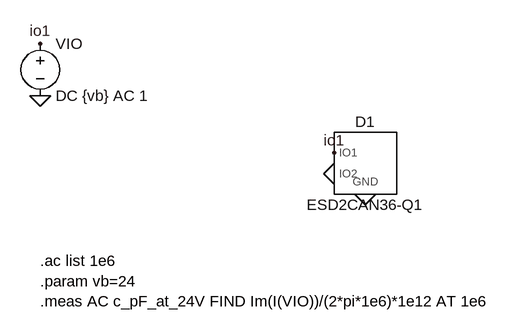
[diagram p0: schematic Model_test_ESD2CAN36_C24.asc]
Model_test_ESD2CAN36_C24.asc, the LTspice schematic file:
Version 4
SHEET 1 1400 700
SYMBOL ESD2CAN36-Q1 600 300 R0
SYMATTR InstName D1
FLAG 552 284 io1
FLAG 552 316 0
FLAG 600 348 0
SYMBOL voltage 100 100 R0
SYMATTR InstName VIO
SYMATTR Value DC {vb} AC 1
FLAG 100 116 io1
FLAG 100 196 0
TEXT 100 450 Left 2 !.ac list 1e6\n.param vb=24\n.meas AC c_pF_at_24V FIND Im(I(VIO))/(2*pi*1e6)*1e12 AT 1e6

The netlist it stands for:
* Model_test_ESD2CAN36_C24.asc
XD1 io1 0 0 ESD2CAN36-Q1  ; pins IO1 IO2 GND
VIO io1 0 DC {vb} AC 1
.ac list 1e6
.param vb=24
.meas AC c_pF_at_24V FIND Im(I(VIO))/(2*pi*1e6)*1e12 AT 1e6
.lib C:\Users\polus\OneDrive\Pulpit\Projekty\Oscyloskop\Symulacje\ESD2CAN36-Q1.lib
.backanno
.end